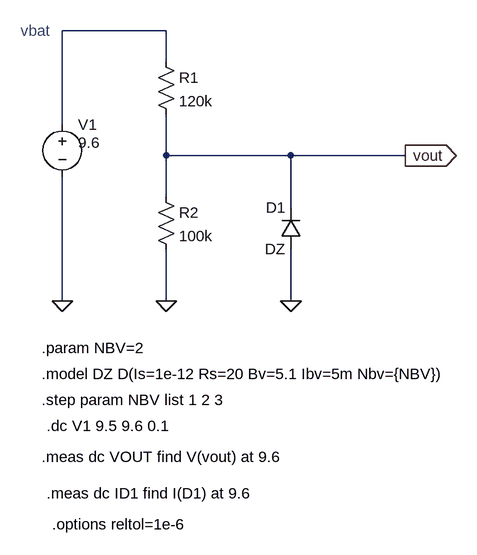
[diagram p0: schematic 05_zener.asc]
05_zener.asc, the LTspice schematic file:
Version 4.1
SHEET 1 968 696
WIRE 336 -80 176 -80
WIRE 336 -32 336 -80
WIRE 176 64 176 -80
WIRE 336 112 336 48
WIRE 528 112 336 112
WIRE 704 112 528 112
WIRE 336 176 336 112
WIRE 528 192 528 112
WIRE 176 336 176 144
WIRE 336 336 336 256
WIRE 528 336 528 256
FLAG 336 336 0
FLAG 176 336 0
FLAG 528 336 0
FLAG 704 112 vout
IOPIN 704 112 Out
SYMBOL voltage 176 48 R0
WINDOW 123 0 0 Left 0
WINDOW 39 0 0 Left 0
WINDOW 3 24 44 Left 2
SYMATTR Value 9.6
SYMATTR InstName V1
SYMBOL res 320 -48 R0
SYMATTR InstName R1
SYMATTR Value 120k
SYMBOL res 320 160 R0
SYMATTR InstName R2
SYMATTR Value 100k
SYMBOL diode 544 256 R180
WINDOW 0 24 64 Left 2
WINDOW 3 24 0 Left 2
SYMATTR InstName D1
SYMATTR Value DZ
TEXT 112 -80 Left 2 ;vbat
TEXT 144 408 Left 2 !.param NBV=2
TEXT 144 448 Left 2 !.model DZ D(Is=1e-12 Rs=20 Bv=5.1 Ibv=5m Nbv={NBV})
TEXT 144 488 Left 2 !.step param NBV list 1 2 3
TEXT 144 576 Left 2 !.meas dc VOUT find V(vout) at 9.6
TEXT 152 632 Left 2 !.meas dc ID1 find I(D1) at 9.6
TEXT 152 528 Left 2 !.dc V1 9.5 9.6 0.1
TEXT 160 680 Left 2 !.options reltol=1e-6

The netlist it stands for:
* 05_zener.asc
V1 N001 0 9.6
R1 N001 vout 120k
R2 vout 0 100k
D1 0 vout DZ
.model D D
.lib standard.dio
* vbat
.param NBV=2
.model DZ D(Is=1e-12 Rs=20 Bv=5.1 Ibv=5m Nbv={NBV})
.step param NBV list 1 2 3
.meas dc VOUT find V(vout) at 9.6
.meas dc ID1 find I(D1) at 9.6
.dc V1 9.5 9.6 0.1
.options reltol=1e-6
.backanno
.end